# Altium schematic sheet 基础器件串讲.SchDoc
size 1651 x 1651 mm; SheetNumber: 3; SheetTotal: 17
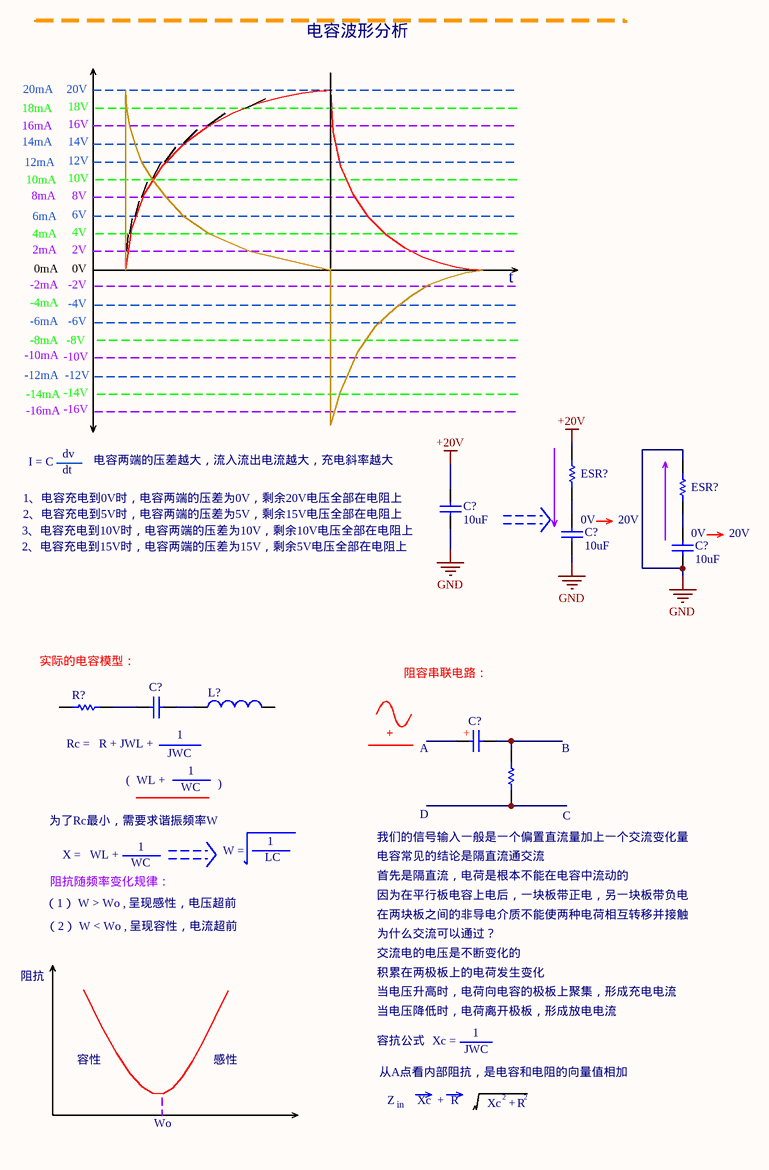
[diagram p0: 基础器件串讲.SchDoc]

## Parts
(Parts that share a designator on the sheet are numbered #1, #2 ... from top to bottom, then left to right.)
C?#1  value 10uF  (hidden comment: Capacitor)
C?#2  value 10uF  (hidden comment: Capacitor)
C?#3  value 10uF  (hidden comment: Capacitor)
C?#4  Capacitor  (value not drawn)
C?#5  Capacitor  (value not drawn)
ESR?#1  Resistor  (value not drawn)
ESR?#2  Resistor  (value not drawn)
ESR?#3  Resistor  (value not drawn)
L?  Inductor  (value not drawn)
R?  Resistor  (value not drawn)

## Nets
+20V: C?#1.2 ESR?#1.2
GND: C?#1.1 C?#2.1 C?#3.1 ESR?#2.2
NetC?#2_2: C?#2.2 ESR?#1.1
NetC?#3_2: C?#3.2 ESR?#2.1
NetC?#4_1: C?#4.1 R?.2
NetC?#4_2: C?#4.2 L?.1
NetC?#5_2: C?#5.2 ESR?#3.1

Not connected (* = marked no-connect by the designer): C?#5 1; ESR?#3 2; L? 2; R? 1

## Notes on the sheet
- 电容波形分析
- 16mA
- 18mA
- 20mA
- 20V
- 16V
- 18V
- 14mA
- 12mA
- 10mA
- 8mA
- 10V
- 12V
- 14V
- 8V
- 2mA
- 4mA
- 6mA
- 0mA
- 0V
- 2V
- 4V
- 6V
- -2mA
- -4mA
- -6mA
- -8mA
- -8V
- -2V
- -4V
- -6V
- t
- -10mA
- -12mA
- -14mA
- -10V
- -14V
- -12V
- -16mA
- I = C
- dv
- dt
- -16V
- 电容两端的压差越大，流入流出电流越大，充电斜率越大
- 3、电容充电到10V时，电容两端的压差为10V，剩余10V电压全部在电阻上
- 1、电容充电到0V时，电容两端的压差为0V，剩余20V电压全部在电阻上
- 2、电容充电到5V时，电容两端的压差为5V，剩余15V电压全部在电阻上
- (near C?#2) 0V
- (near C?#2) 20V
- (near C?#3) 0V
- 2、电容充电到15V时，电容两端的压差为15V，剩余5V电压全部在电阻上
- 实际的电容模型：
- 阻容串联电路：
- Rc =   R + JWL +
- 1
- +
- (near C?#5) +
- (
- WL +
- JWC
- WC
- (near C?#5) A
- B
- 为了Rc最小，需要求谐振频率W
- 阻抗随频率变化规律：
- X =   WL +
- W =
- LC
- (near ESR?#3) 我们的信号输入一般是一个偏置直流量加上一个交流变化量
- 电容常见的结论是隔直流通交流
- 首先是隔直流，电荷是根本不能在电容中流动的
- D
- C
- （1） W > Wo , 呈现感性，电压超前
- （2） W < Wo , 呈现容性，电流超前
- 因为在平行板电容上电后，一块板带正电，另一块板带负电
- 在两块板之间的非导电介质不能使两种电荷相互转移并接触
- 为什么交流可以通过？
- 阻抗
- 交流电的电压是不断变化的
- 积累在两极板上的电荷发生变化
- 当电压升高时，电荷向电容的极板上聚集，形成充电电流
- 当电压降低时，电荷离开极板，形成放电电流
- 容性
- 感性
- 容抗公式
- 从A点看内部阻抗，是电容和电阻的向量值相加
- Xc =
- Wo
- Z
- in
- Xc  +
- R
- Xc
- 2

## Library data of the parts
C?#1-C?#3 C?#5 = Capacitor: SimulationGenericComponent: True
C?#4 = Capacitor: SimulationGenericComponent: True; Value: 1p
ESR?#1-ESR?#3 = Resistor: TC1: 0; SimulationGenericComponent: True; TC2: 0
L? = Inductor: SimulationGenericComponent: True; Value: 1u
R? = Resistor: TC1: 0; SimulationGenericComponent: True; Value: 1K; TC2: 0